# Altium schematic sheet MPU-System.SchDoc
size A4; SheetNumber: 1; SheetTotal: 7
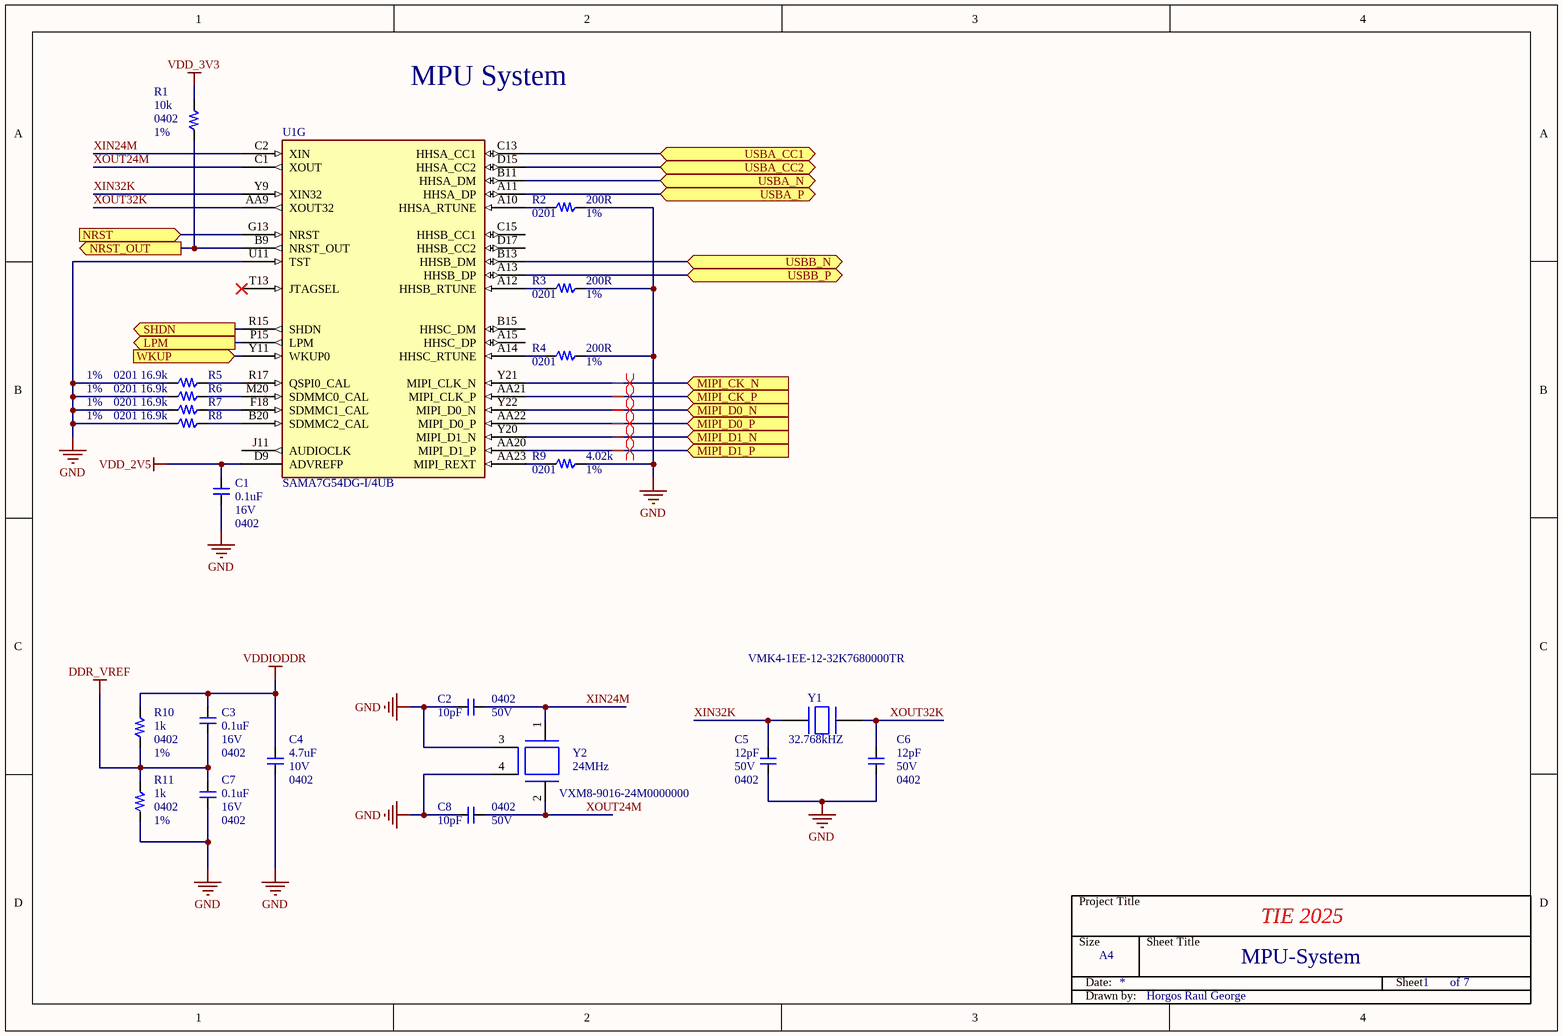
[diagram p0: MPU-System.SchDoc]

## Parts
C1  0.1uF  Rated Voltage: 16V  Package: 0402  [CAP0402]
C2  10pF  Rated Voltage: 50V  Package: 0402  [CAP0402]
C3  0.1uF  Rated Voltage: 16V  Package: 0402  [CAP0402]
C4  4.7uF  Package: 0402  Rated Voltage: 10V  [CAP0402]
C5  12pF  Rated Voltage: 50V  Package: 0402  [CAP0402]
C6  12pF  Rated Voltage: 50V  Package: 0402  [CAP0402]
C7  0.1uF  Rated Voltage: 16V  Package: 0402  [CAP0402]
C8  10pF  Rated Voltage: 50V  Package: 0402  [CAP0402]
R1  10k  Tolerance: 1%  Package: 0402  [RES0402]
R2  200R  Tolerance: 1%  Package: 0201  [RES0201]
R3  200R  Tolerance: 1%  Package: 0201  [RES0201]
R4  200R  Tolerance: 1%  Package: 0201  [RES0201]
R5  16.9k  Tolerance: 1%  Package: 0201  [RES0201]
R6  16.9k  Tolerance: 1%  Package: 0201  [RES0201]
R7  16.9k  Tolerance: 1%  Package: 0201  [RES0201]
R8  16.9k  Tolerance: 1%  Package: 0201  [RES0201]
R9  4.02k  Package: 0201  Tolerance: 1%  [RES0201]
R10  1k  Tolerance: 1%  Package: 0402  [RES0402]
R11  1k  Tolerance: 1%  Package: 0402  [RES0402]
Title_1  Title Block  (value not drawn)  (graphical)
U1  SAMA7G54DG-I/4UB  [BGA427C80P25X21_2100X1800X120]  (part G of 8)
Y1  32.768kHZ  [VMK4-1EE-12-32K7680000TR]
Y2  24MHz  [VXM8-9016-24M0000000]

## Ports
LPM (out, see PMIC[1A]), MIPI_CK_N (in, see SDCard-MIPI-User[1A]), MIPI_CK_P (in, see SDCard-MIPI-User[1B]), MIPI_D0_N (in, see SDCard-MIPI-User[1A]), MIPI_D0_P (in, see SDCard-MIPI-User[1A]), MIPI_D1_N (in, see SDCard-MIPI-User[1A]), MIPI_D1_P (in, see SDCard-MIPI-User[1A]), NRST (in, see PMIC[1B], SDCard-MIPI-User[2D]), NRST_OUT (out, see Ethernet[1D]), SHDN (out, see PMIC[1A]), USBA_CC1 (bidir, see USB[2A]), USBA_CC2 (bidir, see USB[2B]), USBA_N (bidir, see USB[2A]), USBA_P (bidir, see USB[2A]), USBB_N (bidir, see USB[2D]), USBB_P (bidir, see USB[2D]), WKUP (in, see PMIC[1B])

## Nets
DDR_VREF: C3.1 C7.2 R10.1 R11.2
GND: C1.1 C2.1 C4.1 C5.1 C6.1 C7.1 C8.1 R2.2 R3.2 R4.2 R5.1 R6.1 R7.1 R8.1 R9.2 R11.1 U1.U11(TST) Y2.3 Y2.4
VDD_2V5: C1.2 U1.D9(ADVREFP)
VDD_3V3: R1.2
VDDIODDR: C3.2 C4.2 R10.2
LPM: U1.P15(LPM) ; port LPM
MIPI_CK_N: U1.Y21(MIPI_CLK_N) ; port MIPI_CK_N
MIPI_CK_P: U1.AA21(MIPI_CLK_P) ; port MIPI_CK_P
MIPI_D0_N: U1.Y22(MIPI_D0_N) ; port MIPI_D0_N
MIPI_D0_P: U1.AA22(MIPI_D0_P) ; port MIPI_D0_P
MIPI_D1_N: U1.Y20(MIPI_D1_N) ; port MIPI_D1_N
MIPI_D1_P: U1.AA20(MIPI_D1_P) ; port MIPI_D1_P
NRST: U1.G13(NRST) ; port NRST
NRST_OUT: R1.1 U1.B9(NRST_OUT) ; port NRST_OUT
SHDN: U1.R15(SHDN) ; port SHDN
USBA_CC1: U1.C13(HHSA_CC1) ; port USBA_CC1
USBA_CC2: U1.D15(HHSA_CC2) ; port USBA_CC2
USBA_N: U1.B11(HHSA_DM) ; port USBA_N
USBA_P: U1.A11(HHSA_DP) ; port USBA_P
USBB_N: U1.B13(HHSB_DM) ; port USBB_N
USBB_P: U1.A13(HHSB_DP) ; port USBB_P
WKUP: U1.Y11(WKUP0) ; port WKUP
XIN24M: C2.2 U1.C2(XIN) Y2.1
XIN32K: C5.2 U1.Y9(XIN32) Y1.1
XOUT24M: C8.2 U1.C1(XOUT) Y2.2
XOUT32K: C6.2 U1.AA9(XOUT32) Y1.2
NetR2_1: R2.1 U1.A10(HHSA_RTUNE)
NetR3_1: R3.1 U1.A12(HHSB_RTUNE)
NetR4_1: R4.1 U1.A14(HHSC_RTUNE)
NetR5_2: R5.2 U1.R17(QSPI0_CAL)
NetR6_2: R6.2 U1.M20(SDMMC0_CAL)
NetR7_2: R7.2 U1.F18(SDMMC1_CAL)
NetR8_2: R8.2 U1.B20(SDMMC2_CAL)
NetR9_1: R9.1 U1.AA23(MIPI_REXT)

Not connected (* = marked no-connect by the designer): U1 A15(HHSC_DP) B15(HHSC_DM) C15(HHSB_CC1) D17(HHSB_CC2) J11(AUDIOCLK) T13(JTAGSEL)*

## Layout directives
differential pair: MIPI_CK_N, MIPI_CK_P, MIPI_D0_N, MIPI_D0_P, MIPI_D1_N, MIPI_D1_P

## Notes on the sheet
- MPU System
- MPU-System
- (in symbol Title Block) Project Title; TIE 2025; Size; Sheet Title; A4; Date:; Sheet; of; Drawn by:; Horgos Raul George

## Library data of the parts
C1 C3 C7 = C0402C104K4RAC7867: CAP CER 0.1uF 16V 10% X7R SMD 0402; Manufacturer: KEMET; .Checked_PCB: AI; Manufacturer Part Number: C0402C104K4RAC7867; .Checked_SCH: AI; .Creator: AI
C2 C8 = QSCF500Q100J1GV001T: CAP CER 10pF 50V 5% C0G/NP0 SMD 0402; Manufacturer: Johanson Technology; .Checked_PCB: AI; Manufacturer Part Number: QSCF500Q100J1GV001T; .Checked_SCH: AI; .Creator: AI
C4 = C1005X5R1A475K050BC: CAP CER 4.7uF 10V 10% X5R SMD 0402; Manufacturer: TDK Corporation; .Checked_PCB: AI; Manufacturer Part Number: C1005X5R1A475K050BC; .Checked_SCH: AI; .Creator: AI
C5 C6 = QSCF500Q120J1GV001T: CAP CER 12pF 50V 5% C0G/NP0 SMD 0402; Manufacturer: Johanson Technology; .Checked_PCB: AI; Manufacturer Part Number: QSCF500Q120J1GV001T; .Checked_SCH: AI; .Creator: AI
R1 = ERJ-2RKF1002X: RES TKF 10k 1% 1/10W SMD 0402; Manufacturer: Panasonic; Manufacturer Part Number: ERJ-2RKF1002X
R2-R4 = CR0201-FW-2000GLF: RES TKF 200R 1% 1/20W SMD 0201; Manufacturer: Bourns Inc.; Manufacturer Part Number: CR0201-FW-2000GLF
R5-R8 = ERJ-1GNF1692C: RES TKF 16.9k 1% 1/20W SMD 0201; Manufacturer: Panasonic Electronic; Manufacturer Part Number: ERJ-1GNF1692C
R9 = RC0201FR-074K02L: RES TKF 4.02k 1% 1/20W SMD 0201; Manufacturer: Yageo; Manufacturer Part Number: RC0201FR-074K02L
R10 R11 = ERJ-2RKF1001X: RES TKF 1k 1% 1/10W SMD 0402; Manufacturer: Panasonic; Manufacturer Part Number: ERJ-2RKF1001X
U1 = SAMA7G54DG-I/4UB: MCHP MPU SiP 32-BIT Cortex-A7 1000MHz 128kB 2Gbit / SAMA7G54D2G-I/4UB LFBGA-427; Manufacturer: Microchip Technology; Manufacturer Part Number: SAMA7G54DG-I/4UB
Y1 = VMK4-1EE-12-32K7680000TR: MCHP CRYSTAL 32.768kHz 12.5pF VMK4-1EE-12-32K7680000TR / SMD L2.0W1.2H0.5; Manufacturer: Microchip Technology; Manufacturer Part Number: VMK4-1EE-12-32K7680000TR
Y2 = VXM8-9016-24M0000000: MCHP CRYSTAL 24MHz 10pF VXM8-9016-24M000000 SMD / L2.5W2H0.55; Manufacturer: Microchip Technology; Manufacturer Part Number: VXM8-9016-24M0000000